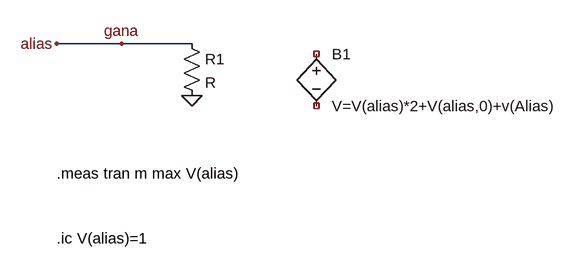
[diagram p0: schematic etiqueta-alias-en-expresion.asc]
etiqueta-alias-en-expresion.asc, the LTspice schematic file:
Version 4
SHEET 1 880 680
WIRE 0 0 208 0
FLAG 0 0 alias
FLAG 100 0 gana
FLAG 208 80 0
SYMBOL res 192 -16 R0
SYMATTR InstName R1
SYMBOL bv 400 0 R0
SYMATTR InstName B1
SYMATTR Value V=V(alias)*2+V(alias,0)+v(Alias)
TEXT 0 200 Left 2 !.meas tran m max V(alias)
TEXT 0 300 Left 2 !.ic V(alias)=1

The netlist it stands for:
* etiqueta-alias-en-expresion.asc
R1 gana 0 R
B1 NC_01 NC_02 V=V(alias)*2+V(alias,0)+v(Alias)
.meas tran m max V(alias)
.ic V(alias)=1
.backanno
.end